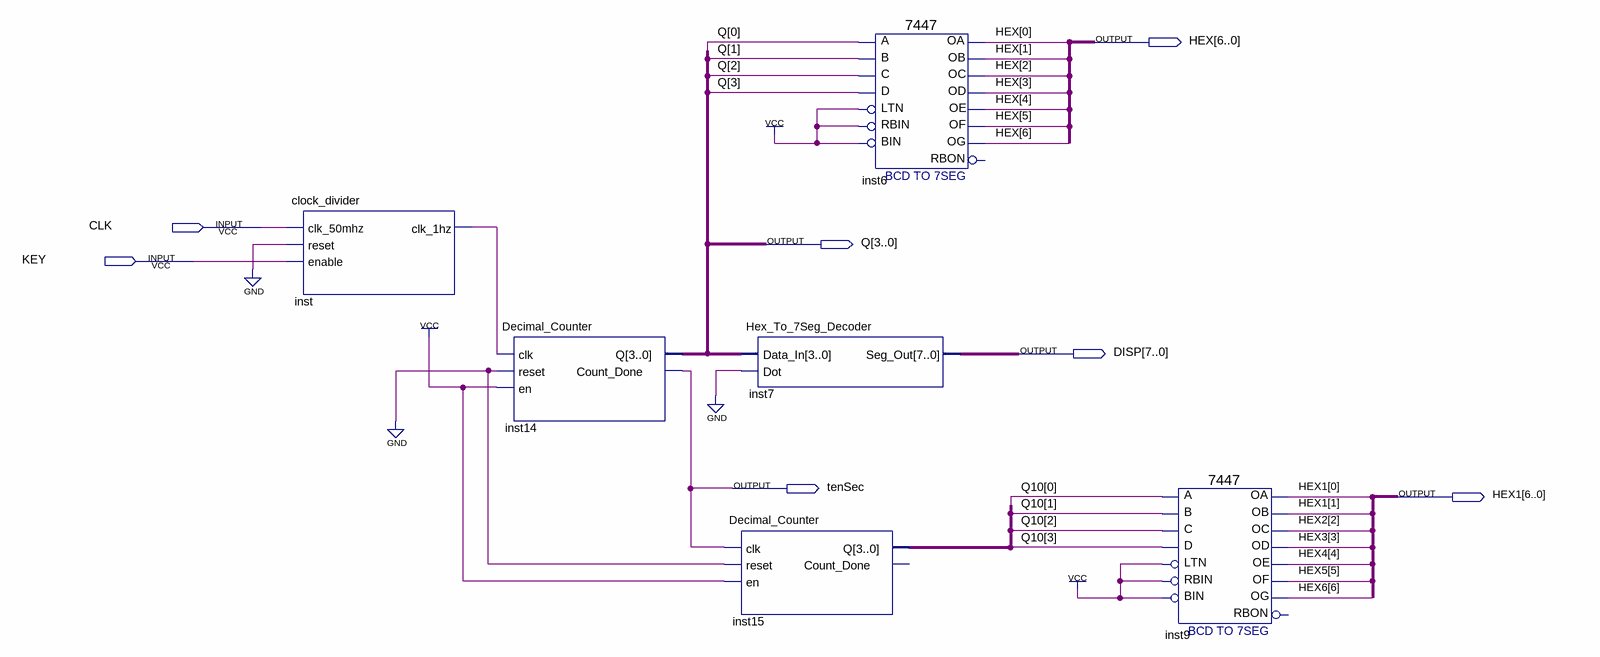
[diagram p0: schematic sheet]
// Quartus schematic TenCnt.bdf as structural Verilog: 6 symbols, 7 pins
module TenCnt (
  input  CLK,
  input  KEY,
  output [6:0] HEX,
  output [3:0] Q,
  output [7:0] DISP,
  output tenSec,
  output [6:0] HEX1
);

  wire inst_clk_1hz;
  wire [2:2] HEX2;
  wire [3:0] inst15_q, Q10;
  wire [3:3] HEX3;
  wire [4:4] HEX4;
  wire [5:5] HEX5;
  wire [6:6] HEX6;

  clock_divider inst (.clk_50mhz(CLK), .reset(1'b0), .enable(KEY), .clk_1hz(inst_clk_1hz));
  Decimal_Counter inst14 (.clk(inst_clk_1hz), .reset(1'b0), .en(1'b1), .Q(Q), .Count_Done(tenSec));
  Decimal_Counter inst15 (.clk(tenSec), .reset(1'b0), .en(1'b1), .Q(inst15_q));  // open: Count_Done
  Hex_To_7Seg_Decoder inst7 (.Data_In(Q), .Dot(1'b0), .Seg_Out(DISP));
  \7447  inst6 (
    .LTN(1'b1), .B(Q[1]), .C(Q[2]), .D(Q[3]), .RBIN(1'b1), .BIN(1'b1), .A(Q[0]), .OB(HEX[1]), .OC(HEX[2]),
    .OE(HEX[4]), .OD(HEX[3]), .OF(HEX[5]), .OG(HEX[6]), .OA(HEX[0]));  // open: RBON
  \7447  inst9 (
    .LTN(1'b1), .B(Q10[1]), .C(Q10[2]), .D(Q10[3]), .RBIN(1'b1), .BIN(1'b1), .A(Q10[0]), .OB(HEX1[1]),
    .OC(HEX2[2]), .OE(HEX4[4]), .OD(HEX3[3]), .OF(HEX5[5]), .OG(HEX6[6]), .OA(HEX1[0]));  // open: RBON
endmodule
